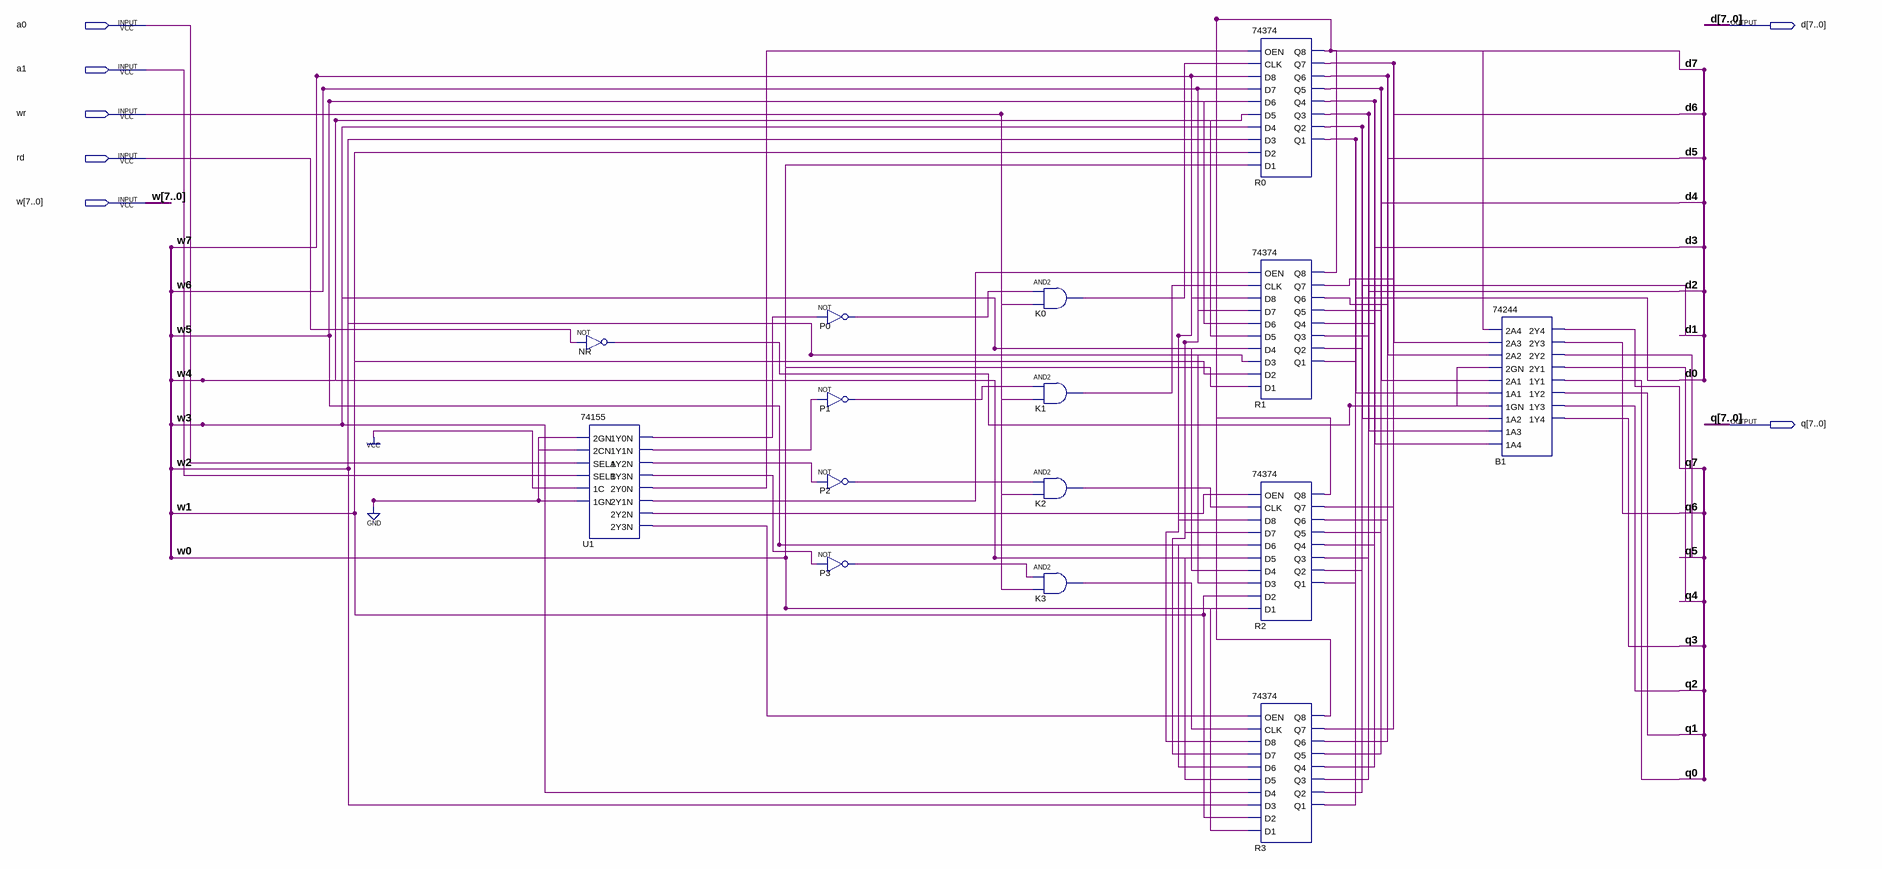
[diagram p0: schematic sheet]
// Quartus schematic mem4x8.bdf as structural Verilog: 15 symbols, 7 pins
module mem4x8 (
  input  a0,
  input  a1,
  input  wr,
  input  rd,
  input  [7:0] w,
  output [7:0] d,
  output [7:0] q
);

  wire K0_out, K1_out, K2_out, K3_out, NR_out, P0_out, P1_out, P2_out, P3_out, U1_1y0n, U1_1y1n, U1_1y2n,
       U1_1y3n, U1_2y0n, U1_2y1n, U1_2y2n, U1_2y3n;

  not NR (NR_out, rd);
  \74155  U1 (
    .\2GN (1'b0), .\2CN (1'b0), .SELA(a0), .SELB(a1), .\1C (1'b1), .\1GN (1'b0), .\1Y0N (U1_1y0n),
    .\1Y1N (U1_1y1n), .\1Y2N (U1_1y2n), .\1Y3N (U1_1y3n), .\2Y0N (U1_2y0n), .\2Y1N (U1_2y1n),
    .\2Y2N (U1_2y2n), .\2Y3N (U1_2y3n));
  not P0 (P0_out, U1_1y0n);
  not P1 (P1_out, U1_1y1n);
  not P2 (P2_out, U1_1y2n);
  not P3 (P3_out, U1_1y3n);
  and K0 (K0_out, P0_out, wr);
  and K1 (K1_out, P1_out, wr);
  and K2 (K2_out, P2_out, wr);
  and K3 (K3_out, P3_out, wr);
  \74374  R0 (
    .OEN(U1_2y0n), .CLK(K0_out), .D8(w[7]), .D7(w[6]), .D6(w[5]), .D5(w[4]), .D4(w[3]), .D3(w[2]), .D2(w[1]),
    .D1(w[0]), .Q8(d[7]), .Q7(d[6]), .Q6(d[5]), .Q5(d[4]), .Q4(d[3]), .Q3(d[2]), .Q2(d[1]), .Q1(d[0]));
  \74374  R1 (
    .OEN(U1_2y1n), .CLK(K1_out), .D8(w[7]), .D7(w[6]), .D6(w[5]), .D5(w[4]), .D4(w[3]), .D3(w[2]), .D2(w[1]),
    .D1(w[0]), .Q8(d[7]), .Q7(d[6]), .Q6(d[5]), .Q5(d[4]), .Q4(d[3]), .Q3(d[2]), .Q2(d[1]), .Q1(d[0]));
  \74374  R2 (
    .OEN(U1_2y2n), .CLK(K2_out), .D8(w[7]), .D7(w[6]), .D6(w[5]), .D5(w[4]), .D4(w[3]), .D3(w[2]), .D2(w[1]),
    .D1(w[0]), .Q8(d[7]), .Q7(d[6]), .Q6(d[5]), .Q5(d[4]), .Q4(d[3]), .Q3(d[2]), .Q2(d[1]), .Q1(d[0]));
  \74374  R3 (
    .OEN(U1_2y3n), .CLK(K3_out), .D8(w[7]), .D7(w[6]), .D6(w[5]), .D5(w[4]), .D4(w[3]), .D3(w[2]), .D2(w[1]),
    .D1(w[0]), .Q8(d[7]), .Q7(d[6]), .Q6(d[5]), .Q5(d[4]), .Q4(d[3]), .Q3(d[2]), .Q2(d[1]), .Q1(d[0]));
  \74244  B1 (
    .\2A4 (d[7]), .\2A3 (d[6]), .\2A2 (d[5]), .\2GN (NR_out), .\2A1 (d[4]), .\1A1 (d[0]), .\1GN (NR_out),
    .\1A2 (d[1]), .\1A3 (d[2]), .\1A4 (d[3]), .\2Y4 (q[7]), .\2Y3 (q[6]), .\2Y2 (q[5]), .\2Y1 (q[4]),
    .\1Y1 (q[0]), .\1Y2 (q[1]), .\1Y3 (q[2]), .\1Y4 (q[3]));
endmodule
